# Altium project RF-Hub-v1.0.PrjPcb (part 2 of 4)

## Sheet CC1101.SchDoc
size 420 x 297 mm; SheetNumber: 3; SheetTotal: 5
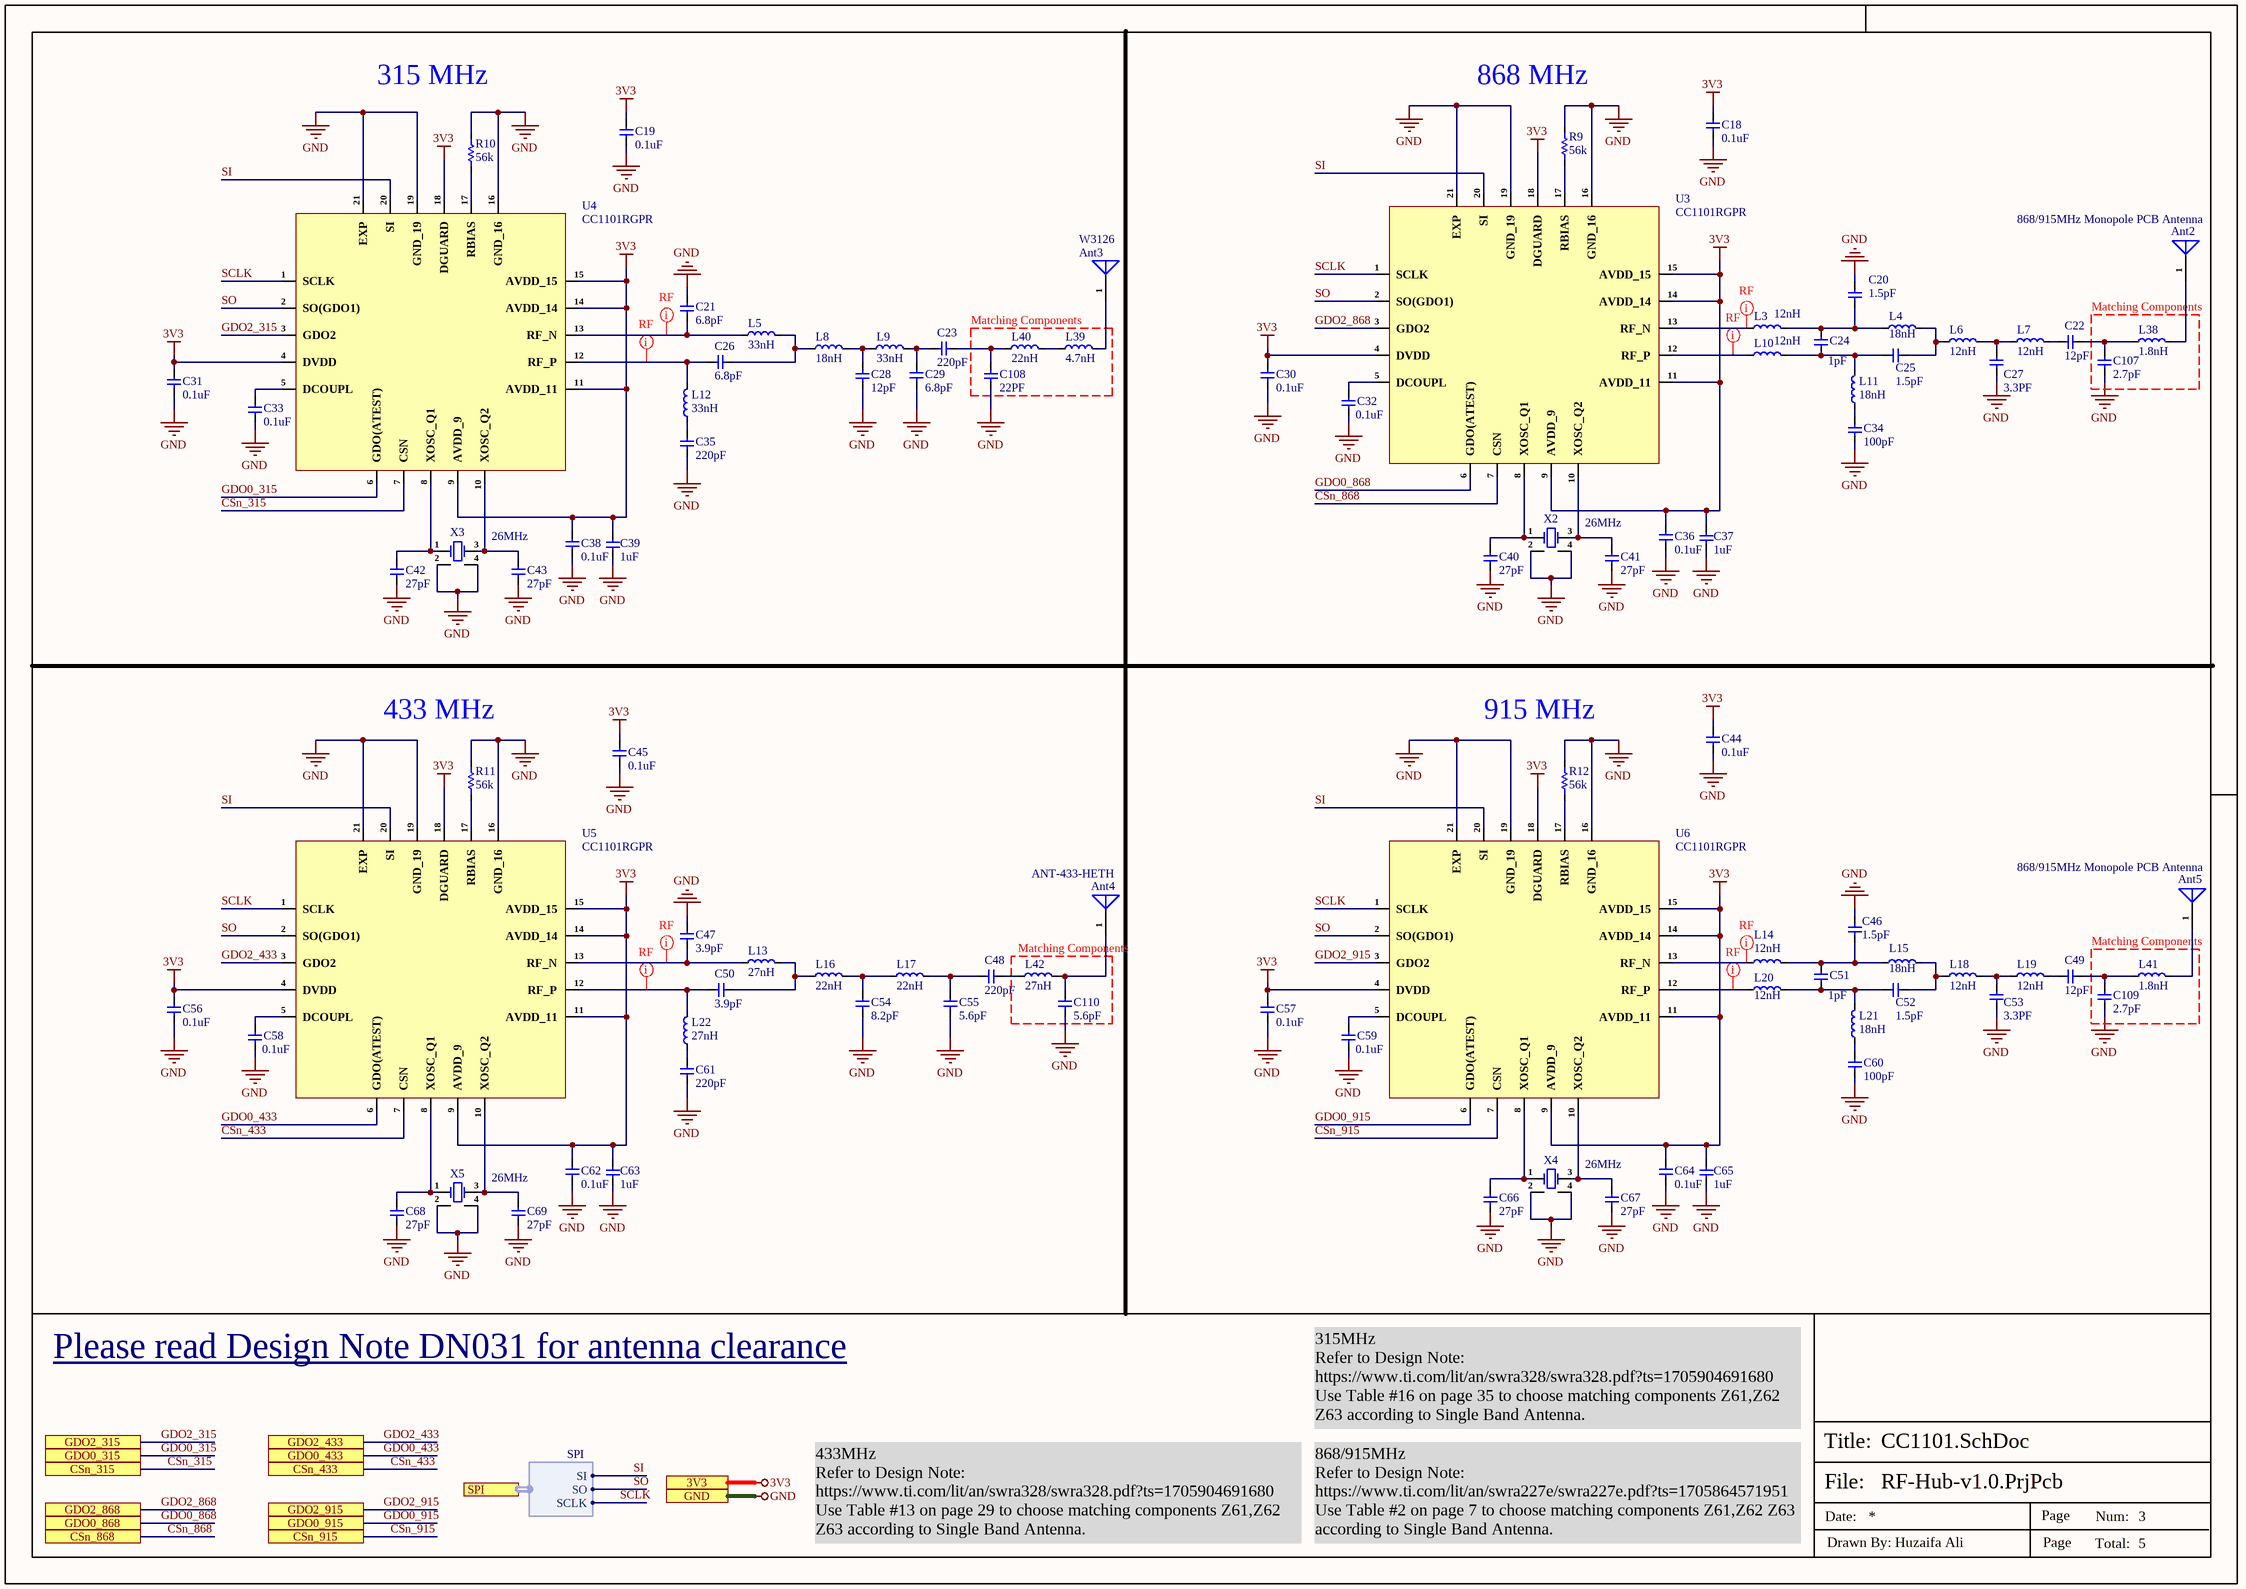
[diagram p1: CC1101.SchDoc]

### Parts
Ant2  868/915MHz Monopole PCB Antenna  [868/915MHz Monopole PCB Antenna]
Ant3  W3126  [W3126]
Ant4  ANT-433-HETH  [ANT-433-HETH]
Ant5  868/915MHz Monopole PCB Antenna  [868/915MHz Monopole PCB Antenna]
C18  0.1uF  [Cap-0402]
C19  0.1uF  [Cap-0402]
C20  1.5pF  [Cap-0402]
C21  6.8pF  [Cap-0402]
C22  12pF  [Cap-0402]
C23  220pF  [Cap-0402]
C24  1pF  [Cap-0402]
C25  1.5pF  [Cap-0402]
C26  6.8pF  [Cap-0402]
C27  3.3PF  [Cap-0402]
C28  12pF  [Cap-0402]
C29  6.8pF  [Cap-0402]
C30  0.1uF  [Cap-0402]
C31  0.1uF  [Cap-0402]
C32  0.1uF  [Cap-0402]
C33  0.1uF  [Cap-0402]
C34  100pF  [Cap-0402]
C35  220pF  [Cap-0402]
C36  0.1uF  [Cap-0402]
C37  1uF  [Cap-0402]
C38  0.1uF  [Cap-0402]
C39  1uF  [Cap-0402]
C40  27pF  [Cap-0402]
C41  27pF  [Cap-0402]
C42  27pF  [Cap-0402]
C43  27pF  [Cap-0402]
C44  0.1uF  [Cap-0402]
C45  0.1uF  [Cap-0402]
C46  1.5pF  [Cap-0402]
C47  3.9pF  [Cap-0402]
C48  220pF  [Cap-0402]
C49  12pF  [Cap-0402]
C50  3.9pF  [Cap-0402]
C51  1pF  [Cap-0402]
C52  1.5pF  [Cap-0402]
C53  3.3PF  [Cap-0402]
C54  8.2pF  [Cap-0402]
C55  5.6pF  [Cap-0402]
C56  0.1uF  [Cap-0402]
C57  0.1uF  [Cap-0402]
C58  0.1uF  [Cap-0402]
C59  0.1uF  [Cap-0402]
C60  100pF  [Cap-0402]
C61  220pF  [Cap-0402]
C62  0.1uF  [Cap-0402]
C63  1uF  [Cap-0402]
C64  0.1uF  [Cap-0402]
C65  1uF  [Cap-0402]
C66  27pF  [Cap-0402]
C67  27pF  [Cap-0402]
C68  27pF  [Cap-0402]
C69  27pF  [Cap-0402]
C107  2.7pF  [CAP-0201]
C108  22PF  [Cap-0402]
C109  2.7pF  [CAP-0201]
C110  5.6pF  [Cap-0402]
L3  12nH  [IND-0402]
L4  18nH  [IND-0402]
L5  33nH  [IND-0402]
L6  12nH  [IND-0402]
L7  12nH  [IND-0402]
L8  18nH  [IND-0402]
L9  33nH  [IND-0402]
L10  12nH  [IND-0402]
L11  18nH  [IND-0402]
L12  33nH  [IND-0402]
L13  27nH  [IND-0402]
L14  12nH  [IND-0402]
L15  18nH  [IND-0402]
L16  22nH  [IND-0402]
L17  22nH  [IND-0402]
L18  12nH  [IND-0402]
L19  12nH  [IND-0402]
L20  12nH  [IND-0402]
L21  18nH  [IND-0402]
L22  27nH  [IND-0402]
L38  1.8nH  [IND-0402]
L39  4.7nH  [IND-0402]
L40  22nH  [IND-0402]
L41  1.8nH  [IND-0402]
L42  27nH  [IND-0402]
R9  56k  [Res-0402]
R10  56k  [Res-0402]
R11  56k  [Res-0402]
R12  56k  [Res-0402]
U3  CC1101RGPR  [20-QFN (4x4)]
U4  CC1101RGPR  [20-QFN (4x4)]
U5  CC1101RGPR  [20-QFN (4x4)]
U6  CC1101RGPR  [20-QFN (4x4)]
X2  26MHz  [NX3225GA-26MHZ-EXS00A-CG01972]
X3  26MHz  [NX3225GA-26MHZ-EXS00A-CG01972]
X4  26MHz  [NX3225GA-26MHZ-EXS00A-CG01972]
X5  26MHz  [NX3225GA-26MHZ-EXS00A-CG01972]

### Blocks framed on the sheet
Matching Components: C107 L38
Matching Components: C108 L39 L40
Matching Components: C110 L42
Matching Components: C109 L41

### Ports
3V3 (see Top-Sheet[1C], Controller-Sheet[2D], Power-Sheet[1D], Wide-Band[2D]), CSn_315 (see Top-Sheet[2B], Controller-Sheet[1D]), CSn_433 (see Top-Sheet[2B], Controller-Sheet[1D]), CSn_868 (see Top-Sheet[2B], Controller-Sheet[1D]), CSn_915 (see Top-Sheet[2B], Controller-Sheet[1D]), GDO0_315 (see Top-Sheet[2B], Controller-Sheet[1D]), GDO0_433 (see Top-Sheet[2B], Controller-Sheet[1D]), GDO0_868 (see Top-Sheet[2B], Controller-Sheet[1D]), GDO0_915 (see Top-Sheet[2B], Controller-Sheet[1D]), GDO2_315 (see Top-Sheet[2B], Controller-Sheet[1D]), GDO2_433 (see Top-Sheet[2B], Controller-Sheet[1D]), GDO2_868 (see Top-Sheet[2B], Controller-Sheet[1D]), GDO2_915 (see Top-Sheet[2B], Controller-Sheet[1D]), GND (see Top-Sheet[1C], Controller-Sheet[2D], Power-Sheet[1D], Wide-Band[2D]), SPI (harness SPI, see Top-Sheet[1B], Controller-Sheet[3D], Wide-Band[1D])

### Harnesses
SPI: SI, SO, SCLK

### Nets
3V3: C18.1 C19.1 C30.1 C31.1 C36.1 C37.2 C38.1 C39.2 C44.1 C45.1 C56.1 C57.1 C62.1 C63.2 C64.1 C65.2 U3.4(DVDD) U3.9(AVDD_9) U3.11(AVDD_11) U3.14(AVDD_14) U3.15(AVDD_15) U3.18(DGUARD) U4.4(DVDD) U4.9(AVDD_9) U4.11(AVDD_11) U4.14(AVDD_14) U4.15(AVDD_15) U4.18(DGUARD) U5.4(DVDD) U5.9(AVDD_9) U5.11(AVDD_11) U5.14(AVDD_14) U5.15(AVDD_15) U5.18(DGUARD) U6.4(DVDD) U6.9(AVDD_9) U6.11(AVDD_11) U6.14(AVDD_14) U6.15(AVDD_15) U6.18(DGUARD) ; port 3V3
GND: C18.2 C19.2 C20.2 C21.2 C27.1 C28.1 C29.2 C30.2 C31.2 C32.1 C33.1 C34.1 C35.1 C36.2 C37.1 C38.2 C39.1 C40.1 C41.1 C42.1 C43.1 C44.2 C45.2 C46.2 C47.2 C53.1 C54.1 C55.1 C56.2 C57.2 C58.1 C59.1 C60.1 C61.1 C62.2 C63.1 C64.2 C65.1 C66.1 C67.1 C68.1 C69.1 C107.1 C108.1 C109.1 C110.1 R9.2 R10.2 R11.2 R12.2 U3.16(GND_16) U3.19(GND_19) U3.21(EXP) U4.16(GND_16) U4.19(GND_19) U4.21(EXP) U5.16(GND_16) U5.19(GND_19) U5.21(EXP) U6.16(GND_16) U6.19(GND_19) U6.21(EXP) X2.2(GND) X2.4(GND) X3.2(GND) X3.4(GND) X4.2(GND) X4.4(GND) X5.2(GND) X5.4(GND) ; port GND
CSn_315: U4.7(CSN) ; port CSn_315
CSn_433: U5.7(CSN) ; port CSn_433
CSn_868: U3.7(CSN) ; port CSn_868
CSn_915: U6.7(CSN) ; port CSn_915
GDO0_315: U4.6(GDO(ATEST)) ; port GDO0_315
GDO0_433: U5.6(GDO(ATEST)) ; port GDO0_433
GDO0_868: U3.6(GDO(ATEST)) ; port GDO0_868
GDO0_915: U6.6(GDO(ATEST)) ; port GDO0_915
GDO2_315: U4.3(GDO2) ; port GDO2_315
GDO2_433: U5.3(GDO2) ; port GDO2_433
GDO2_868: U3.3(GDO2) ; port GDO2_868
GDO2_915: U6.3(GDO2) ; port GDO2_915
SCLK: U3.1(SCLK) U4.1(SCLK) U5.1(SCLK) U6.1(SCLK) ; port SPI.SCLK
SI: U3.20(SI) U4.20(SI) U5.20(SI) U6.20(SI) ; port SPI.SI
SO: U3.2(SO(GDO1)) U4.2(SO(GDO1)) U5.2(SO(GDO1)) U6.2(SO(GDO1)) ; port SPI.SO
NetAnt2_1: Ant2.1(FEED) L38.2
NetAnt3_1: Ant3.1(FEED) L39.2
NetAnt4_1: Ant4.1(FEED) C110.2 L42.2
NetAnt5_1: Ant5.1(FEED) L41.2
NetC20_1: C20.1 C24.2 L3.2 L4.1
NetC21_1: C21.1 L5.1 U4.13(RF_N)
NetC22_1: C22.1 L7.2
NetC22_2: C22.2 C107.2 L38.1
NetC23_1: C23.1 C108.2 L40.1
NetC23_2: C23.2 C29.1 L9.2
NetC24_1: C24.1 C25.2 L10.2 L11.2
NetC25_1: C25.1 L4.2 L6.1
NetC26_1: C26.1 L12.2 U4.12(RF_P)
NetC26_2: C26.2 L5.2 L8.1
NetC27_2: C27.2 L6.2 L7.1
NetC28_2: C28.2 L8.2 L9.1
NetC32_2: C32.2 U3.5(DCOUPL)
NetC33_2: C33.2 U4.5(DCOUPL)
NetC34_2: C34.2 L11.1
NetC35_2: C35.2 L12.1
NetC40_2: C40.2 U3.8(XOSC_Q1) X2.1(OSC1)
NetC41_2: C41.2 U3.10(XOSC_Q2) X2.3(OSC2)
NetC42_2: C42.2 U4.8(XOSC_Q1) X3.1(OSC1)
NetC43_2: C43.2 U4.10(XOSC_Q2) X3.3(OSC2)
NetC46_1: C46.1 C51.2 L14.2 L15.1
NetC47_1: C47.1 L13.1 U5.13(RF_N)
NetC48_1: C48.1 L42.1
NetC48_2: C48.2 C55.2 L17.2
NetC49_1: C49.1 L19.2
NetC49_2: C49.2 C109.2 L41.1
NetC50_1: C50.1 L13.2 L16.1
NetC50_2: C50.2 L22.2 U5.12(RF_P)
NetC51_1: C51.1 C52.2 L20.2 L21.2
NetC52_1: C52.1 L15.2 L18.1
NetC53_2: C53.2 L18.2 L19.1
NetC54_2: C54.2 L16.2 L17.1
NetC58_2: C58.2 U5.5(DCOUPL)
NetC59_2: C59.2 U6.5(DCOUPL)
NetC60_2: C60.2 L21.1
NetC61_2: C61.2 L22.1
NetC66_2: C66.2 U6.8(XOSC_Q1) X4.1(OSC1)
NetC67_2: C67.2 U6.10(XOSC_Q2) X4.3(OSC2)
NetC68_2: C68.2 U5.8(XOSC_Q1) X5.1(OSC1)
NetC69_2: C69.2 U5.10(XOSC_Q2) X5.3(OSC2)
NetL3_1: L3.1 U3.13(RF_N)
NetL10_1: L10.1 U3.12(RF_P)
NetL14_1: L14.1 U6.13(RF_N)
NetL20_1: L20.1 U6.12(RF_P)
NetL39_1: L39.1 L40.2
NetR9_1: R9.1 U3.17(RBIAS)
NetR10_1: R10.1 U4.17(RBIAS)
NetR11_1: R11.1 U5.17(RBIAS)
NetR12_1: R12.1 U6.17(RBIAS)

### Layout directives
net class RF: NetC21_1, NetC26_1, NetC47_1, NetC50_2, NetL3_1, NetL10_1, NetL14_1, NetL20_1

### Notes on the sheet
- (near R10) 315 MHz
- (near R9) 868 MHz
- (near R11) 433 MHz
- (near R12) 915 MHz
- Please read Design Note DN031 for antenna clearance <https://www.ti.com/lit/an/swra328/swra328.pdf?ts=1705904691680>
- 315MHz
  Refer to Design Note: https://www.ti.com/lit/an/swra328/swra328.pdf?ts=1705904691680
  Use Table #16 on page 35 to choose matching components Z61,Z62 Z63 according to Single Band Antenna.
- 433MHz
  Refer to Design Note: https://www.ti.com/lit/an/swra328/swra328.pdf?ts=1705904691680
  Use Table #13 on page 29 to choose matching components Z61,Z62 Z63 according to Single Band Antenna.
- 868/915MHz
  Refer to Design Note: https://www.ti.com/lit/an/swra227e/swra227e.pdf?ts=1705864571951
  Use Table #2 on page 7 to choose matching components Z61,Z62 Z63 according to Single Band Antenna.
- File:
- Title:
- Date:
- Page
- Num:
- Total:
- Drawn By: Huzaifa Ali

### Library data of the parts
Ant2 Ant5 = 868/915MHz Monopole PCB Antenna: Monopole PCB Antenna with Single or Dual Band Option; Manufacturer Part Number: 868/915MHz Monopole PCB Antenna; Item Type: Antenna; ComponentLink1Description: Anttena; ComponentLink1URL: https://www.ti.com/lit/an/swra227e/swra227e.pdf?ts=1705864571951
Ant3 = W3126: RF ANT 315MHZ HELICAL SOLDER SMD; Manufacturer: Pulse; Impedance: 50R; Number of Bands: 1; Return Loss: -10dB; Gain: -5dB; VSWR: 1.9; Item Type: Antenna; Supplier: Mouser; Supplier Part Number: 673-W3126; Manufacturer Part Number: W3126; RoHS: Yes; Category: RF Antennas; Stock: 256; Pricing: 1=1.73, 10=1.55, 50=1.55, 100=1.25, 1000=0.852, 10000=0.735 (USD); Mounting Technology: Surface Mount,Through Hole,PCB; Packaging: Tray; Series: -; Package Quantity: 1600; Termination: Solder; Frequency: 315MHz; Height: 0.276inch; Radiation Hardening: No; ComponentLink1URL: https://datasheet.ciiva.com/8153/+w3126-8153071.pdf?src-supplier=Avnet; ComponentLink1Description: https://datasheet.ciiva.com/8153/+w3126-8153071.pdf?src-supplier=Avnet; ComponentLink2URL: https://datasheet.ciiva.com/2792/+w3126-2792620.pdf?src-supplier=Digikey; ComponentLink2Description: https://datasheet.ciiva.com/2792/+w3126-2792620.pdf?src-supplier=Digikey
Ant4 = ANT-433-HETH: RF ANT 433MHZ HELICAL SLD TH; Manufacturer: TE Connectivity; Item Type: Antenna; Manufacturer Part Number: ANT-433-HETH; Package: Custom
C18 C19 C30 C31 C36 C38 C44 C45 C56 C57 C62 C64 = C1005X5R1H104K050BB: CAP CER 0.1UF 50V X5R 0402; Manufacturer: TDK; Dielectric Material: Ceramic; Capacitance: 100nF; Tolerance: 10%; Supplier 1: Digi-Key; Manufacturer Part Number: C1005X5R1H104K050BB; Stock 1: 1455182; Pricing 1: 1=0.12, 10=0.09, 50=0.049, 100=0.04, 500=0.02858, 1000=0.02245, 2500=0.02041, 5000=0.01878 (USD); Mount: Surface Mount; Case/Package: 0402; Case Code (Metric): 1005; Case Code (Imperial): 0402; Weight: 2.3E-05oz; Min Operating Temperature: -55°C; Max Operating Temperature: 85°C; Dielectric: X5R; Voltage Rating: 50V; Packaging: Tape and Reel; Voltage Rating (DC): 50V; Termination: SMD/SMT; Construction: Flat; Package Quantity: 1; Resistor Type: Ceramic; Voltage: 50V; Series: C; Length: 1mm; Width: 0.02inch; Height: 0.5mm; Depth: 0.5mm; Thickness: 0.022inch; Radiation Hardening: No; Lead Free: Lead Free; REACH SVHC: No SVHC; RoHS Compliant: Yes; ComponentLink1URL: https://product.tdk.com/info/en/catalog/spec/mlccspec_commercial_general_midvoltage_en.pdf?src-supplier=Digi-Key; ComponentLink1Description: https://product.tdk.com/info/en/catalog/spec/mlccspec_commercial_general_midvoltage_en.pdf?src-supplier=Digi-Key; ComponentLink2URL: http://www.tdk.co.jp/tefe02/e413_c.pdf?src-supplier=Future+Electronics; ComponentLink2Description: http://www.tdk.co.jp/tefe02/e413_c.pdf?src-supplier=Future+Electronics; ComponentLink3URL: https://www.verical.com/server-webapp/html/getDatasheet?partID=743571&src-supplier=Verical; ComponentLink3Description: https://www.verical.com/server-webapp/html/getDatasheet?partID=743571&src-supplier=Verical; ComponentLink4URL: http://www.tdk.co.jp/tefe02/e412_c.pdf?src-supplier=Avnet+Europe; ComponentLink4Description: http://www.tdk.co.jp/tefe02/e412_c.pdf?src-supplier=Avnet+Europe; Supplier Part Number 1: 445-5942-1-ND; LCSC Part Number: C2181865
C20 C25 C46 C52 = CC0402BRNPO9BN1R5: CAP CER 1.5PF 50V C0G/NPO 0402; Manufacturer: Yageo; Temperature Coefficient: 30ppm/°C; Item Type: Capacitor; Supplier: Future Electronics; Supplier Part Number: 6564710; Manufacturer Part Number: CC0402BRNPO9BN1R5; RoHS: Yes; Category: Ceramic Capacitors; Stock: 530000; Pricing: 10000=0.0033, 40000=0.0031, 150000=0.003, 300000=0.0029, 750000=0.0027 (USD); Halogen Free: 5694HalogenFree; ComponentLink1URL: https://datasheet.ciiva.com/15189/getdatasheetpartid-403423-15189101.pdf?src-supplier=Verical; ComponentLink1Description: https://datasheet.ciiva.com/15189/getdatasheetpartid-403423-15189101.pdf?src-supplier=Verical; ComponentLink2URL: https://datasheet.ciiva.com/11587/upy-gp-np0-16v-to-50v-8-11587119.pdf?src-supplier=Avnet; ComponentLink2Description: https://datasheet.ciiva.com/11587/upy-gp-np0-16v-to-50v-8-11587119.pdf?src-supplier=Avnet; ComponentLink3URL: https://datasheet.ciiva.com/13263/upy-gp-np0-16v-to-50v-8-3714-13263317.pdf?src-supplier=Mouser; ComponentLink3Description: https://datasheet.ciiva.com/13263/upy-gp-np0-16v-to-50v-8-3714-13263317.pdf?src-supplier=Mouser; LCSC Part Number: C282238
C21 C26 C29 = CC0402CRNPO9BN6R8: CAP CER 6.8PF 50V C0G/NPO 0402; Manufacturer: Yageo; Dielectric: C0G; Tolerance: 2%; Insulation Resistance: 10GR; Item Type: Capacitor; Supplier: Future Electronics; Supplier Part Number: 3247368; Manufacturer Part Number: CC0402CRNPO9BN6R8; RoHS: Yes; Category: Ceramic Capacitors; Stock: 200000; Pricing: 10000=0.0024, 40000=0.0022, 150000=0.0021, 400000=0.002, 1000000=0.0019 (USD); Mounting Technology: Surface Mount; Case/Package: 0402; Case Code (Imperial): 0402; Case Code (Metric): 1005; Weight: 2.3E-05oz; Min Operating Temperature: -55°C; Max Operating Temperature: 125°C; Value: 6.8pF; Packaging: Tape and Reel; Voltage Rating: 50V; Voltage Rating (DC): 50V; Termination: SMD/SMT; Series: CC; Construction: Flat; Length: 1mm; Width: 0.5mm; Height: 0.5mm; Depth: 0.5mm; Radiation Hardening: No; RoHS Compliant: Yes; ComponentLink1URL: https://datasheet.ciiva.com/11587/upy-gp-np0-16v-to-50v-8-11587182.pdf?src-supplier=Avnet; ComponentLink1Description: https://datasheet.ciiva.com/11587/upy-gp-np0-16v-to-50v-8-11587182.pdf?src-supplier=Avnet; LCSC Part Number: C189470
C22 C28 C49 = GJM1555C1H120GB01D: CAP CER 12PF 50V C0G/NP0 0402; Manufacturer: Murata; Tolerance: 2%; Dielectric: C0G; Supplier 1: Digi-Key; Manufacturer Part Number: GJM1555C1H120GB01D; RoHS: Yes; Category: Ceramic Capacitors; Stock 1: 266975; Pricing 1: 1=0.18000, 10=0.12600, 50=0.07560, 100=0.06390, 500=0.04370, 1000=0.03865, 2500=0.03698, 5000=0.03361 (USD); Mount: Surface Mount; Case/Package: 0402; Case Code (Imperial): 0402; Case Code (Metric): 1005; Min Operating Temperature: -55°C; Max Operating Temperature: 125°C; Capacitance: 12pF; Voltage Rating: 50V; Voltage Rating (DC): 50V; Packaging: Tape and Reel; Package Quantity: 10000; Termination: SMD/SMT; Series: GJM; Construction: Flat; Length: 1mm; Width: 0.5mm; Height: 0.5mm; Thickness: 0.022inch; Depth: 0.5mm; Radiation Hardening: No; Lead Free: Lead Free; RoHS Compliant: Yes; ComponentLink1URL: https://datasheet.ciiva.com/11608/product-11608208.pdf?src-supplier=Avnet; ComponentLink1Description: https://datasheet.ciiva.com/11608/product-11608208.pdf?src-supplier=Avnet; ComponentLink2URL: https://datasheet.ciiva.com/29542/partnumbering-e-01-29542716.pdf?src-supplier=Digi-Key; ComponentLink2Description: https://datasheet.ciiva.com/29542/partnumbering-e-01-29542716.pdf?src-supplier=Digi-Key; ComponentLink3URL: https://datasheet.ciiva.com/29542/partnumbering-e-01-29542715.pdf?src-supplier=Digi-Key; ComponentLink3Description: https://datasheet.ciiva.com/29542/partnumbering-e-01-29542715.pdf?src-supplier=Digi-Key; ComponentLink4URL: https://datasheet.ciiva.com/29542/partnumbering-e-01-29542717.pdf?src-supplier=Digi-Key; ComponentLink4Description: https://datasheet.ciiva.com/29542/partnumbering-e-01-29542717.pdf?src-supplier=Digi-Key; Supplier Part Number 1: 490-8078-1-ND; LCSC Part Number: C161305
C23 C35 C48 C61 = CC0402JRNPO9BN221: CAP CER 220PF 50V C0G/NPO 0402; Manufacturer: Yageo; Dielectric Material: Ceramic; Tolerance: 10%; Dielectric: C0G; Temperature Coefficient: 30ppm/°C; Insulation Resistance: 10GR; Dissipation Factor: 0.1%; Supplier 1: RSComponents; Manufacturer Part Number: CC0402JRNPO9BN221; RoHS: Yes; Category: Ceramic Capacitors; Stock 1: 20000; Pricing 1: 10000=0.00600, 100000=0.00600 (GBP); Mount: Surface Mount; Case/Package: 0402; Number of Pins: 2; Case Code (Metric): 1005; Case Code (Imperial): 0402; Min Operating Temperature: -55°C; Max Operating Temperature: 125°C; Capacitance: 220pF; Package Quantity: 1; Voltage Rating: 50V; Packaging: Tape and Reel; Termination: SMD/SMT; Voltage: 50V; Series: CC; Length: 1mm; Width: 0.02inch; Height: 0.5mm; Thickness: 0.022inch; Depth: 0.5mm; Radiation Hardening: No; RoHS Compliant: Yes; REACH SVHC: No SVHC; Lead Free: Lead Free; ComponentLink1URL: https://datasheet.ciiva.com/11786/0900766b8079c870-11786154.pdf?src-supplier=RSComponents; ComponentLink1Description: https://datasheet.ciiva.com/11786/0900766b8079c870-11786154.pdf?src-supplier=RSComponents; ComponentLink2URL: https://datasheet.ciiva.com/7656/1132289-7656616.pdf?src-supplier=Element14; ComponentLink2Description: https://datasheet.ciiva.com/7656/1132289-7656616.pdf?src-supplier=Element14; ComponentLink3URL: https://datasheet.ciiva.com/8033/1443161-8033609.pdf?src-supplier=Element14; ComponentLink3Description: https://datasheet.ciiva.com/8033/1443161-8033609.pdf?src-supplier=Element14; ComponentLink4URL: https://datasheet.ciiva.com/8033/1443161-8033608.pdf?src-supplier=Element14; ComponentLink4Description: https://datasheet.ciiva.com/8033/1443161-8033608.pdf?src-supplier=Element14; ComponentLink5URL: https://datasheet.ciiva.com/176/mlccorderingcode-176384.pdf?src-supplier=Digi-Key; ComponentLink5Description: https://datasheet.ciiva.com/176/mlccorderingcode-176384.pdf?src-supplier=Digi-Key; ComponentLink6URL: https://datasheet.ciiva.com/176/mlccorderingcode-176383.pdf?src-supplier=Digi-Key; ComponentLink6Description: https://datasheet.ciiva.com/176/mlccorderingcode-176383.pdf?src-supplier=Digi-Key; ComponentLink7URL: https://datasheet.ciiva.com/176/mlccorderingcode-176385.pdf?src-supplier=Digi-Key; ComponentLink7Description: https://datasheet.ciiva.com/176/mlccorderingcode-176385.pdf?src-supplier=Digi-Key; ComponentLink8URL: https://datasheet.ciiva.com/17434/upy-gp-np0-16v-to-50v-8-17434343.pdf?src-supplier=Avnet+Europe; ComponentLink8Description: https://datasheet.ciiva.com/17434/upy-gp-np0-16v-to-50v-8-17434343.pdf?src-supplier=Avnet+Europe; Supplier Part Number 1: 6169284; LCSC Part Number: C107001
C24 C51 = CC0402BRNPO9BN1R0: CAP CER 1PF 50V C0G/NPO 0402; Manufacturer: Yageo; Temperature Coefficient: 30ppm/°C; Item Type: Capacitor; Supplier: Future Electronics; Supplier Part Number: 7847221; Manufacturer Part Number: CC0402BRNPO9BN1R0; RoHS: Yes; Category: Ceramic Capacitors; Stock: 180000; Pricing: 10000=0.0034, 40000=0.0032, 150000=0.0031, 250000=0.003, 500000=0.0028 (USD); Halogen Free: 5694HalogenFree; ComponentLink1URL: https://datasheet.ciiva.com/26862/getdatasheetpartid-403422-26862565.pdf?src-supplier=Verical; ComponentLink1Description: https://datasheet.ciiva.com/26862/getdatasheetpartid-403422-26862565.pdf?src-supplier=Verical; ComponentLink2URL: https://datasheet.ciiva.com/11587/upy-gp-np0-16v-to-50v-8-11587115.pdf?src-supplier=Avnet; ComponentLink2Description: https://datasheet.ciiva.com/11587/upy-gp-np0-16v-to-50v-8-11587115.pdf?src-supplier=Avnet; LCSC Part Number: C309455
C27 C53 = RF15N3R3C500CT: CAP CER 3.3PF 50V C0G/NP0 0402; Manufacturer: Walsin Tech Corp; Item Type: Capacitor; Manufacturer Part Number: RF15N3R3C500CT; Package: 0402; LCSC Part Number: C172822; ComponentLink1Description: LCSC; ComponentLink1URL: https://www.lcsc.com/product-detail/Multilayer-Ceramic-Capacitors-MLCC-SMD-SMT_Walsin-Tech-Corp-RF15N3R3C500CT_C172822.html
C32 C33 C58 C59 = C1005X5R1H104K050BB: CAP CER 0.1UF 50V X5R 0402; Manufacturer: TDK; Dielectric Material: Ceramic; Capacitance: 100nF; Tolerance: 10%; Item Type: Capacitor; Supplier 1: Digi-Key; Manufacturer Part Number: C1005X5R1H104K050BB; Stock 1: 1455182; Pricing 1: 1=0.12, 10=0.09, 50=0.049, 100=0.04, 500=0.02858, 1000=0.02245, 2500=0.02041, 5000=0.01878 (USD); Mount: Surface Mount; Case/Package: 0402; Case Code (Metric): 1005; Case Code (Imperial): 0402; Weight: 2.3E-05oz; Min Operating Temperature: -55°C; Max Operating Temperature: 85°C; Dielectric: X5R; Voltage Rating: 50V; Packaging: Tape and Reel; Voltage Rating (DC): 50V; Termination: SMD/SMT; Construction: Flat; Package Quantity: 1; Resistor Type: Ceramic; Voltage: 50V; Series: C; Length: 1mm; Width: 0.02inch; Height: 0.5mm; Depth: 0.5mm; Thickness: 0.022inch; Radiation Hardening: No; Lead Free: Lead Free; REACH SVHC: No SVHC; RoHS Compliant: Yes; ComponentLink1URL: https://product.tdk.com/info/en/catalog/spec/mlccspec_commercial_general_midvoltage_en.pdf?src-supplier=Digi-Key; ComponentLink1Description: https://product.tdk.com/info/en/catalog/spec/mlccspec_commercial_general_midvoltage_en.pdf?src-supplier=Digi-Key; ComponentLink2URL: http://www.tdk.co.jp/tefe02/e413_c.pdf?src-supplier=Future+Electronics; ComponentLink2Description: http://www.tdk.co.jp/tefe02/e413_c.pdf?src-supplier=Future+Electronics; ComponentLink3URL: https://www.verical.com/server-webapp/html/getDatasheet?partID=743571&src-supplier=Verical; ComponentLink3Description: https://www.verical.com/server-webapp/html/getDatasheet?partID=743571&src-supplier=Verical; ComponentLink4URL: http://www.tdk.co.jp/tefe02/e412_c.pdf?src-supplier=Avnet+Europe; ComponentLink4Description: http://www.tdk.co.jp/tefe02/e412_c.pdf?src-supplier=Avnet+Europe; Supplier Part Number 1: 445-5942-1-ND; LCSC Part Number: C2181865
C34 C60 = 04025A101JAT2A: CAP CER 100PF 50V C0G/NP0 0402; Manufacturer: Kyocera AVX; Tolerance: 5%; Dielectric: C0G; Insulation Resistance: 1GR; Temperature Coefficient: 30ppm/°C; Dissipation Factor: 2.5%; Item Type: Capacitor; Supplier 1: Avnet; Manufacturer Part Number: 04025A101JAT2A; RoHS: Yes; Category: Ceramic Capacitors; Stock 1: 3437500; Pricing 1: 10000=0.10788, 20000=0.10540, 40000=0.10292, 60000=0.10044, 80000=0.09796, 100000=0.09548, 1000000=0.09424 (USD); Mount: Surface Mount,PCB; Case/Package: 0402; Case Code (Metric): 1005; Case Code (Imperial): 0402; Contact Plating: Tin,Matte; Min Operating Temperature: -55°C; Max Operating Temperature: 125°C; Capacitance: 100pF; Voltage Rating (DC): 50V; Packaging: Tape and Reel; Voltage Rating: 50V; Package Quantity: 10000; Termination: SMD/SMT; Voltage: 50V; Series: -; Construction: Flat; Length: 1mm; Width: 0.004inch; Height: 0.56mm; Thickness: 0.013inch; Depth: 0.5mm; Radiation Hardening: No; Reach SVHC Compliant: Yes; Lead Free: Lead Free; RoHS Compliant: Yes; ComponentLink1URL: https://datasheet.ciiva.com/11786/0900766b80def0e2-11786618.pdf?src-supplier=RSComponents; ComponentLink1Description: https://datasheet.ciiva.com/11786/0900766b80def0e2-11786618.pdf?src-supplier=RSComponents; ComponentLink2URL: https://datasheet.ciiva.com/1123/493359-1123473.pdf?src-supplier=Element14; ComponentLink2Description: https://datasheet.ciiva.com/1123/493359-1123473.pdf?src-supplier=Element14; ComponentLink3URL: https://datasheet.ciiva.com/1123/493359-1123474.pdf?src-supplier=Element14; ComponentLink3Description: https://datasheet.ciiva.com/1123/493359-1123474.pdf?src-supplier=Element14; ComponentLink4URL: https://datasheet.ciiva.com/16332/ccog-16332501.pdf?src-supplier=Future+Electronics; ComponentLink4Description: https://datasheet.ciiva.com/16332/ccog-16332501.pdf?src-supplier=Future+Electronics; ComponentLink5URL: https://datasheet.ciiva.com/46392/759117-46392007.pdf?src-supplier=Element14; ComponentLink5Description: https://datasheet.ciiva.com/46392/759117-46392007.pdf?src-supplier=Element14; ComponentLink6URL: https://datasheet.ciiva.com/150/ccog-150473.pdf?src-supplier=Digi-Key; ComponentLink6Description: https://datasheet.ciiva.com/150/ccog-150473.pdf?src-supplier=Digi-Key; ComponentLink7URL: https://datasheet.ciiva.com/150/ccog-150474.pdf?src-supplier=Digi-Key; ComponentLink7Description: https://datasheet.ciiva.com/150/ccog-150474.pdf?src-supplier=Digi-Key; ComponentLink8URL: https://datasheet.ciiva.com/2987/ccog-2987642.pdf?src-supplier=Avnet; ComponentLink8Description: https://datasheet.ciiva.com/2987/ccog-2987642.pdf?src-supplier=Avnet; ComponentLink9URL: https://datasheet.ciiva.com/150/ccog-150475.pdf?src-supplier=Digi-Key; ComponentLink9Description: https://datasheet.ciiva.com/150/ccog-150475.pdf?src-supplier=Digi-Key; ComponentLink10URL: https://datasheet.ciiva.com/8083/ccog-8083054.pdf?src-supplier=Avnet; ComponentLink10Description: https://datasheet.ciiva.com/8083/ccog-8083054.pdf?src-supplier=Avnet; ComponentLink11URL: https://datasheet.ciiva.com/5413/ccog-5413647.pdf?src-supplier=Mouser; ComponentLink11Description: https://datasheet.ciiva.com/5413/ccog-5413647.pdf?src-supplier=Mouser; Supplier Part Number 1: 04025A101JAT2A; LCSC Part Number: C597014
C37 C39 C63 C65 = CC0402KRX5R6BB105: CAP CER 1UF 10V X5R 0402; Manufacturer: Yageo; Tolerance: 10%; Dissipation Factor: 15%; Supplier 1: Mouser; Manufacturer Part Number: CC0402KRX5R6BB105; RoHS: Yes; Category: Ceramic Capacitors; Stock 1: 6711367; Pricing 1: 1=0.11000, 10=0.05500, 50=0.05500, 100=0.03300, 500=0.02700, 1000=0.02200, 2500=0.02100, 10000=0.01800 (USD); Mount: Surface Mount; Case/Package: 0402; Number of Pins: 2; Case Code (Metric): 1005; Case Code (Imperial): 0402; Min Operating Temperature: -55°C; Max Operating Temperature: 85°C; Capacitance: 1uF; Dielectric: X5R; Package Quantity: 1; Voltage Rating: 10V; Packaging: Tape and Reel; Voltage Rating (DC): 10V; Termination: SMD/SMT; Resistor Type: Ceramic; Series: CC; Construction: Flat; Length: 1mm; Width: 0.02inch; Height: 0.5mm; Thickness: 0.022inch; Depth: 0.5mm; Radiation Hardening: No; REACH SVHC: No SVHC; Lead Free: Lead Free; Halogen Free: Halogen Free; RoHS Compliant: Yes; ComponentLink1URL: https://datasheet.ciiva.com/176/upy-gphc-x5r-4v-to-50v-12-176704.pdf?src-supplier=Digi-Key; ComponentLink1Description: https://datasheet.ciiva.com/176/upy-gphc-x5r-4v-to-50v-12-176704.pdf?src-supplier=Digi-Key; ComponentLink2URL: https://datasheet.ciiva.com/176/mlccorderingcode-176705.pdf?src-supplier=Digi-Key; ComponentLink2Description: https://datasheet.ciiva.com/176/mlccorderingcode-176705.pdf?src-supplier=Digi-Key; ComponentLink3URL: https://datasheet.ciiva.com/176/mlccorderingcode-176706.pdf?src-supplier=Digi-Key; ComponentLink3Description: https://datasheet.ciiva.com/176/mlccorderingcode-176706.pdf?src-supplier=Digi-Key; Supplier Part Number 1: 603-CC402KRX5R6BB105; LCSC Part Number: C106254
C40-C43 C66-C69 = 0402N270J250CT: CAP CER 27PF 25V C0G/NP0 0402; Manufacturer: Walsin Technologies; Item Type: Capacitor; Supplier 1: Digi-Key; Manufacturer Part Number: 0402N270J250CT; Stock 1: 71180; Pricing 1: 1=0.1, 10=0.017, 50=0.0094, 100=0.0076, 500=0.00544, 1000=0.00427, 2500=0.00388, 5000=0.00357 (USD); RoHS Compliant: Yes; Supplier Part Number 1: 1292-1291-1-ND; LCSC Part Number: C424826; ComponentLink1Description: LCSC; ComponentLink1URL: https://lcsc.com/product-detail/Multilayer-Ceramic-Capacitors-MLCC-SMD-SMT_Walsin-Tech-Corp-0402N270J250CT_C424826.html
C47 C50 = CC0402BRNPO9BN3R9: CAP CER 3.9PF 50V C0G/NPO 0402; Manufacturer: Yageo; Item Type: Capacitor; Supplier: Future Electronics; Supplier Part Number: 4917324; Manufacturer Part Number: CC0402BRNPO9BN3R9; RoHS: Yes; Category: Ceramic Capacitors; Stock: 280000; Pricing: 10000=0.0034, 40000=0.0032, 150000=0.0031, 250000=0.003, 500000=0.0028 (USD); ComponentLink1URL: https://datasheet.ciiva.com/11587/upy-gp-np0-16v-to-50v-8-11587133.pdf?src-supplier=Avnet; ComponentLink1Description: https://datasheet.ciiva.com/11587/upy-gp-np0-16v-to-50v-8-11587133.pdf?src-supplier=Avnet; ComponentLink2URL: https://datasheet.ciiva.com/13211/upy-gp-np0-16v-to-50v-8-13211126.pdf?src-supplier=Mouser; ComponentLink2Description: https://datasheet.ciiva.com/13211/upy-gp-np0-16v-to-50v-8-13211126.pdf?src-supplier=Mouser; LCSC Part Number: C505474
C54 = CC0402DRNPO9BN8R2: CAP CER 8.2PF 50V C0G/NPO 0402; Manufacturer: Yageo; Item Type: Capacitor; Supplier: Future Electronics; Supplier Part Number: 2138063; Manufacturer Part Number: CC0402DRNPO9BN8R2; RoHS: Yes; Category: Ceramic Capacitors; Stock: 120000; Pricing: 10000=0.0024, 40000=0.0022, 150000=0.0021, 400000=0.002, 1000000=0.0019 (USD); ComponentLink1URL: https://datasheet.ciiva.com/144/mlccorderingcode-144589.pdf?src-supplier=Digikey; ComponentLink1Description: https://datasheet.ciiva.com/144/mlccorderingcode-144589.pdf?src-supplier=Digikey; ComponentLink2URL: https://datasheet.ciiva.com/144/mlccorderingcode-144590.pdf?src-supplier=Digikey; ComponentLink2Description: https://datasheet.ciiva.com/144/mlccorderingcode-144590.pdf?src-supplier=Digikey; ComponentLink3URL: https://datasheet.ciiva.com/144/mlccorderingcode-144591.pdf?src-supplier=Digikey; ComponentLink3Description: https://datasheet.ciiva.com/144/mlccorderingcode-144591.pdf?src-supplier=Digikey; ComponentLink4URL: https://datasheet.ciiva.com/13208/upy-gp-np0-16v-to-50v-8-13208987.pdf?src-supplier=Mouser; ComponentLink4Description: https://datasheet.ciiva.com/13208/upy-gp-np0-16v-to-50v-8-13208987.pdf?src-supplier=Mouser; ComponentLink5URL: https://datasheet.ciiva.com/11587/upy-gp-np0-16v-to-50v-8-11587051.pdf?src-supplier=Avnet; ComponentLink5Description: https://datasheet.ciiva.com/11587/upy-gp-np0-16v-to-50v-8-11587051.pdf?src-supplier=Avnet; LCSC Part Number: C327412
C55 C110 = CC0402BRNPO9BN5R6: CAP CER 5.6PF 50V C0G/NPO 0402; Manufacturer: Yageo; Item Type: Capacitor; Supplier: Future Electronics; Supplier Part Number: 3807997; Manufacturer Part Number: CC0402BRNPO9BN5R6; RoHS: Yes; Category: Ceramic Capacitors; Stock: 1840000; Pricing: 10000=0.0035, 40000=0.0031, 50000=0.0033, 150000=0.003, 250000=0.0031, 300000=0.0029, 500000=0.003, 750000=0.0027, 1500000=0.0028 (USD); Halogen Free: 5694HalogenFree; ComponentLink1URL: https://datasheet.ciiva.com/26829/getdatasheetpartid-403430-26829253.pdf?src-supplier=Verical; ComponentLink1Description: https://datasheet.ciiva.com/26829/getdatasheetpartid-403430-26829253.pdf?src-supplier=Verical; ComponentLink2URL: https://datasheet.ciiva.com/13265/upy-gp-np0-16v-to-50v-8-3714-13265516.pdf?src-supplier=Mouser; ComponentLink2Description: https://datasheet.ciiva.com/13265/upy-gp-np0-16v-to-50v-8-3714-13265516.pdf?src-supplier=Mouser; LCSC Part Number: C505468
C107 C109 = CC0201CRNPO9BN2R7: CAP CER 2.7PF 50V C0G/NPO 0201; Manufacturer: Yageo; Dielectric: C0G; Item Type: Capacitor; Supplier: Avnet; Supplier Part Number: CC0201CRNPO9BN2R7; Manufacturer Part Number: CC0201CRNPO9BN2R7; RoHS: Yes; Category: Ceramic Capacitors; Stock: 15000; Pricing: 15000=0.0017 (USD); Mounting Technology: Surface Mount; Case/Package: 0201; Case Code (Imperial): 0201; Case Code (Metric): 0603; Weight: 6E-06oz; Min Operating Temperature: -55°C; Max Operating Temperature: 125°C; Value: 2.7pF; Packaging: Tape and Reel; Voltage Rating (DC): 50V; Voltage Rating: 50V; Termination: SMD/SMT; Series: CC; Length: 0.024inch; Width: 0.012inch; Thickness: 0.013inch; RoHS Compliant: Yes; ComponentLink1URL: https://datasheet.ciiva.com/13208/upy-gp-np0-16v-to-50v-8-13208314.pdf?src-supplier=Mouser; ComponentLink1Description: https://datasheet.ciiva.com/13208/upy-gp-np0-16v-to-50v-8-13208314.pdf?src-supplier=Mouser; LCSC Part Number: C325439
C108 = CC0402JRNPO9BN220: CAP CER 22PF 50V C0G/NPO 0402; Manufacturer: Yageo; Dielectric Material: Ceramic; Tolerance: 5%; Dielectric: C0G; Temperature Coefficient: 30ppm/°C; Insulation Resistance: 100GR; Item Type: Capacitor; Supplier 1: Future Electronics; Manufacturer Part Number: CC0402JRNPO9BN220; RoHS: Yes; Category: Ceramic Capacitors; Stock 1: 200000; Pricing 1: 10000=0.00220, 40000=0.00210, 150000=0.00200, 400000=0.00190, 1000000=0.00180 (USD); Mounting Technology: Surface Mount; Case/Package: 0402; Pins: 2; Case Code (Metric): 1005; Case Code (Imperial): 0402; Min Operating Temperature: -55°C; Max Operating Temperature: 125°C; Value: 22pF; Voltage Rating: 50V; Packaging: Tape and Reel; Package Quantity: 1; Voltage Rating (DC): 50V; Termination: SMD/SMT; Resistor Type: Ceramic; Voltage: 50V; Series: CC; Length: 1mm; Width: 0.02inch; Height: 0.5mm; Thickness: 0.022inch; Depth: 0.5mm; Radiation Hardening: No; Reach SVHC Compliant: Yes; Lead Free: Lead Free; RoHS Compliant: Yes; ComponentLink1URL: https://datasheet.ciiva.com/5789/1443161-5789509.pdf?src-supplier=Farnell; ComponentLink1Description: https://datasheet.ciiva.com/5789/1443161-5789509.pdf?src-supplier=Farnell; ComponentLink2URL: https://datasheet.ciiva.com/8033/1443161-8033606.pdf?src-supplier=Element14; ComponentLink2Description: https://datasheet.ciiva.com/8033/1443161-8033606.pdf?src-supplier=Element14; ComponentLink3URL: https://datasheet.ciiva.com/7656/1132289-7656615.pdf?src-supplier=Element14; ComponentLink3Description: https://datasheet.ciiva.com/7656/1132289-7656615.pdf?src-supplier=Element14; ComponentLink4URL: https://datasheet.ciiva.com/8033/1443161-8033607.pdf?src-supplier=Element14; ComponentLink4Description: https://datasheet.ciiva.com/8033/1443161-8033607.pdf?src-supplier=Element14; ComponentLink5URL: https://datasheet.ciiva.com/8033/1443161-8033605.pdf?src-supplier=Element14; ComponentLink5Description: https://datasheet.ciiva.com/8033/1443161-8033605.pdf?src-supplier=Element14; ComponentLink6URL: https://datasheet.ciiva.com/143/mlccorderingcode-143987.pdf?src-supplier=Digi-Key; ComponentLink6Description: https://datasheet.ciiva.com/143/mlccorderingcode-143987.pdf?src-supplier=Digi-Key; ComponentLink7URL: https://datasheet.ciiva.com/143/mlccorderingcode-143986.pdf?src-supplier=Digi-Key; ComponentLink7Description: https://datasheet.ciiva.com/143/mlccorderingcode-143986.pdf?src-supplier=Digi-Key; ComponentLink8URL: https://datasheet.ciiva.com/143/mlccorderingcode-143988.pdf?src-supplier=Digi-Key; ComponentLink8Description: https://datasheet.ciiva.com/143/mlccorderingcode-143988.pdf?src-supplier=Digi-Key; ComponentLink9URL: https://datasheet.ciiva.com/5425/upy-gp-np0-16v-to-50v-8-5425483.pdf?src-supplier=Mouser; ComponentLink9Description: https://datasheet.ciiva.com/5425/upy-gp-np0-16v-to-50v-8-5425483.pdf?src-supplier=Mouser; ComponentLink10URL: https://datasheet.ciiva.com/15189/getdatasheetpartid-370074-15189117.pdf?src-supplier=Verical; ComponentLink10Description: https://datasheet.ciiva.com/15189/getdatasheetpartid-370074-15189117.pdf?src-supplier=Verical; Supplier Part Number 1: 9105957; LCSC Part Number: C106203
L3 L6 L7 L10 L14 L18-L20 = MHQ1005P12NGT000: FIXED IND 12NH 450MA 240MOHM SMD; Manufacturer: TDK; Item Type: Inductor; Supplier: Digikey; Supplier Part Number: 445-175572-1-ND; Manufacturer Part Number: MHQ1005P12NGT000; RoHS: Yes; Category: Fixed Inductors; Stock: 5317; Pricing: 1=0.18, 10=0.149, 25=0.1368, 50=0.1208, 100=0.1057, 250=0.10068, 500=0.09464, 1000=0.07249, 2500=0.06846 (USD); ComponentLink1URL: https://datasheet.ciiva.com/29693/inductor-commercial-high-frequency-mhq-en-29693630.pdf?src-supplier=Digikey; ComponentLink1Description: https://datasheet.ciiva.com/29693/inductor-commercial-high-frequency-mhq-en-29693630.pdf?src-supplier=Digikey; LCSC Part Number: C3911363
L4 L8 L11 L15 L21 = LQG15HS18NJ02D: FIXED IND 18NH 400MA 360MOHM SMD; Manufacturer: Murata; Core Material: Air; Tolerance: 5%; Self Resonant Frequency: 2.2GHz; Q Factor: 8; Current Rating: 300mA; Shielding: Unshielded; DC Resistance (DCR): 360mR; Test Frequency: 100MHz; Item Type: Inductor; Supplier: Rs; Supplier Part Number: 7254910P; Manufacturer Part Number: LQG15HS18NJ02D; RoHS: Yes; Category: Fixed Inductors; Stock: 4990; Pricing: 100=0.065, 250=0.058, 500=0.049, 1000=0.042 (GBP); Mounting Technology: Surface Mount; Case/Package: 0402; Case Code (Metric): 1005; Case Code (Imperial): 0402; Weight: 2.3E-05oz; Min Operating Temperature: -55°C; Max Operating Temperature: 125°C; Packaging: Tape and Reel; Package Quantity: 1; Inductance Tolerance: 5%; Value: 18nH; Max DC Current: 300mA; Termination: SMD/SMT; DC Current: 300mA; Series: LQG15HS; Max Current Rating: 300mA; Length: 0.039inch; Width: 0.02inch; Height: 0.5mm; Height - Seated (Max): 0.022inch; Depth: 0.55mm; Reach SVHC Compliant: No; Military Standard: Not; Lead Free: Lead Free; RoHS Compliant: Yes; ComponentLink1URL: https://datasheet.ciiva.com/11801/0900766b80f10809-11801396.pdf?src-supplier=Rs; ComponentLink1Description: https://datasheet.ciiva.com/11801/0900766b80f10809-11801396.pdf?src-supplier=Rs; ComponentLink2URL: https://datasheet.ciiva.com/1038/l0075s0083lqg15hs-1038125.pdf?src-supplier=Digikey; ComponentLink2Description: https://datasheet.ciiva.com/1038/l0075s0083lqg15hs-1038125.pdf?src-supplier=Digikey; ComponentLink3URL: https://datasheet.ciiva.com/1038/l0075s0083lqg15hs-1038124.pdf?src-supplier=Digikey; ComponentLink3Description: https://datasheet.ciiva.com/1038/l0075s0083lqg15hs-1038124.pdf?src-supplier=Digikey; ComponentLink4URL: https://datasheet.ciiva.com/1038/l0075s0083lqg15hs-1038126.pdf?src-supplier=Digikey; ComponentLink4Description: https://datasheet.ciiva.com/1038/l0075s0083lqg15hs-1038126.pdf?src-supplier=Digikey; ComponentLink5URL: https://datasheet.ciiva.com/8510/l0075s0083lqg15hs-8510821.pdf?src-supplier=Avnet; ComponentLink5Description: https://datasheet.ciiva.com/8510/l0075s0083lqg15hs-8510821.pdf?src-supplier=Avnet; ComponentLink6URL: https://datasheet.ciiva.com/16444/l0075s0083lqg15hs-16444389.pdf?src-supplier=Future+Electronics; ComponentLink6Description: https://datasheet.ciiva.com/16444/l0075s0083lqg15hs-16444389.pdf?src-supplier=Future+Electronics; LCSC Part Number: C86060
L5 L9 L12 = LQG15HN33NH02D: 300mA 33nH ±3% 670mΩ 0402 Inductors (SMD) ROHS; Manufacturer: Murata Electronics; Manufacturer Part Number: LQG15HN33NH02D; Package: 0402; LCSC Part Number: C2044267; Item Type: Inductor; ComponentLink1Description: LCSC; ComponentLink1URL: https://www.lcsc.com/product-detail/Inductors-SMD_Murata-Electronics-LQG15HN33NH02D_C2044267.html
L13 L22 L42 = LQG15HZ27NH02D: FIXED IND 27NH 350MA 460MOHM SMD; Manufacturer: Murata; Core Material: Air; Tolerance: 3%; Shielding: Unshielded; DC Resistance (DCR): 460mR; Self Resonant Frequency: 1.7GHz; Test Frequency: 100MHz; Item Type: Inductor; Supplier: Mouser; Supplier Part Number: 81-LQG15HZ27NH02D; Manufacturer Part Number: LQG15HZ27NH02D; RoHS: Yes; Category: Fixed Inductors; Stock: 436; Pricing: 1=0.1, 10=0.068, 50=0.068, 100=0.047, 1000=0.03, 10000=0.026 (USD); Mounting Technology: Surface Mount; Case/Package: 0402; Case Code (Imperial): 0402; Case Code (Metric): 1005; Min Operating Temperature: -55°C; Max Operating Temperature: 125°C; Packaging: Cut Tape; Value: 27nH; Current Rating: 350mA; Series: LQG15; Ratings: AEC-Q200; RoHS Compliant: Yes; ComponentLink1URL: http://search.murata.co.jp/Ceramy/image/img/P02/JELF243B-9110.pdf?src-supplier=Digi-Key; ComponentLink1Description: http://search.murata.co.jp/Ceramy/image/img/P02/JELF243B-9110.pdf?src-supplier=Digi-Key; LCSC Part Number: C237452
L16 L40 = LQG15HS22NH02D: FIXED IND 22NH 350MA 420MOHM SMD; Manufacturer: Murata; Core Material: Air; Tolerance: 3%; Shielding: Unshielded; DC Resistance (DCR): 420mR; Self Resonant Frequency: 1.9GHz; Test Frequency: 100MHz; Item Type: Inductor; Supplier: Arrow Electronics; Supplier Part Number: LQG15HS22NH02D; Manufacturer Part Number: LQG15HS22NH02D; RoHS: Yes; Category: Fixed Inductors; Stock: 2924; Pricing: 1=0.0948, 10=0.044, 25=0.0437, 100=0.0323, 250=0.032, 500=0.0317, 1000=0.019 (USD); Mounting Technology: Surface Mount; Case/Package: 0402; Min Operating Temperature: -55°C; Max Operating Temperature: 125°C; Series: LQG15; Value: 22nH; RoHS Compliant: Yes; LCSC Part Number: C2041459
L17 = LQG15HS22NH02D: FIXED IND 22NH 350MA 420MOHM SMD / LQG15HS22NH02D; Manufacturer: Murata; Core Material: Air; Tolerance: 3%; Shielding: Unshielded; DC Resistance (DCR): 420mR; Self Resonant Frequency: 1.9GHz; Test Frequency: 100MHz; Item Type: Inductor; Supplier: Arrow Electronics; Supplier Part Number: LQG15HS22NH02D; Manufacturer Part Number: LQG15HS22NH02D; RoHS: Yes; Category: Fixed Inductors; Stock: 2924; Pricing: 1=0.0948, 10=0.044, 25=0.0437, 100=0.0323, 250=0.032, 500=0.0317, 1000=0.019 (USD); Mounting Technology: Surface Mount; Case/Package: 0402; Min Operating Temperature: -55°C; Max Operating Temperature: 125°C; Series: LQG15; Value: 22nH; RoHS Compliant: Yes; LCSC Part Number: C2041459
L38 L41 = LQG15HS1N8S02D: FIXED IND 1.8NH 950MA 100MOHM SM; Manufacturer: Murata; Item Type: Inductor; Supplier: Arrow Electronics; Supplier Part Number: LQG15HS1N8S02D; Manufacturer Part Number: LQG15HS1N8S02D; RoHS: Yes; Category: Fixed Inductors; Stock: 78648; Pricing: 10000=0.0177, 50000=0.017 (USD); ComponentLink1URL: https://datasheet.ciiva.com/11801/0900766b80f10809-11801404.pdf?src-supplier=Rs; ComponentLink1Description: https://datasheet.ciiva.com/11801/0900766b80f10809-11801404.pdf?src-supplier=Rs; ComponentLink2URL: https://datasheet.ciiva.com/4977/o05e-4977799.pdf?src-supplier=Mouser; ComponentLink2Description: https://datasheet.ciiva.com/4977/o05e-4977799.pdf?src-supplier=Mouser; ComponentLink3URL: https://datasheet.ciiva.com/8510/l0075s0083lqg15hs-8510837.pdf?src-supplier=Avnet; ComponentLink3Description: https://datasheet.ciiva.com/8510/l0075s0083lqg15hs-8510837.pdf?src-supplier=Avnet; ComponentLink4URL: https://datasheet.ciiva.com/6690/l0075s0083lqg15hs-6690759.pdf?src-supplier=Digikey; ComponentLink4Description: https://datasheet.ciiva.com/6690/l0075s0083lqg15hs-6690759.pdf?src-supplier=Digikey; ComponentLink5URL: https://datasheet.ciiva.com/6690/l0075s0083lqg15hs-6690762.pdf?src-supplier=Digikey; ComponentLink5Description: https://datasheet.ciiva.com/6690/l0075s0083lqg15hs-6690762.pdf?src-supplier=Digikey; ComponentLink6URL: https://datasheet.ciiva.com/6690/l0075s0083lqg15hs-6690763.pdf?src-supplier=Digikey; ComponentLink6Description: https://datasheet.ciiva.com/6690/l0075s0083lqg15hs-6690763.pdf?src-supplier=Digikey; LCSC Part Number: C77107
L39 = LQG15HS4N7S02D: FIXED IND 4.7NH 700MA 180MOHM SM; Manufacturer: Murata; Core Material: Air; Self Resonant Frequency: 6GHz; Q Factor: 8; Current Rating: 300mA; Shielding: Unshielded; DC Resistance (DCR): 180mR; Test Frequency: 100MHz; ESR: 160mR; Item Type: Inductor; Supplier: Avnet; Supplier Part Number: LQG15HS4N7S02D; Manufacturer Part Number: LQG15HS4N7S02D; RoHS: Yes; Category: Fixed Inductors; Stock: 30000; Pricing: 10000=0.02036, 20000=0.01989, 40000=0.01942 (USD); Mounting Technology: Surface Mount; Case/Package: 0402; Case Code (Metric): 1005; Case Code (Imperial): 0402; Min Operating Temperature: -55°C; Max Operating Temperature: 125°C; Package Quantity: 1; Packaging: Tape and Reel; Value: 4.7nH; Max DC Current: 300mA; Termination: SMD/SMT; DC Current: 300mA; Series: LQG15HS; Max Current Rating: 300mA; RMS Current (Irms): 700mA; Length: 1mm; Width: 0.02inch; Height: 0.5mm; Height - Seated (Max): 0.022inch; Depth: 0.55mm; Military Standard: Not; Lead Free: Lead Free; RoHS Compliant: Yes; ComponentLink1URL: https://datasheet.ciiva.com/11799/0900766b8090d685-11799034.pdf?src-supplier=Rs; ComponentLink1Description: https://datasheet.ciiva.com/11799/0900766b8090d685-11799034.pdf?src-supplier=Rs; ComponentLink2URL: https://datasheet.ciiva.com/1038/l0075s0083lqg15hs-1038121.pdf?src-supplier=Digikey; ComponentLink2Description: https://datasheet.ciiva.com/1038/l0075s0083lqg15hs-1038121.pdf?src-supplier=Digikey; ComponentLink3URL: https://datasheet.ciiva.com/1038/l0075s0083lqg15hs-1038123.pdf?src-supplier=Digikey; ComponentLink3Description: https://datasheet.ciiva.com/1038/l0075s0083lqg15hs-1038123.pdf?src-supplier=Digikey; ComponentLink4URL: https://datasheet.ciiva.com/8509/l0075s0083lqg15hs-8509718.pdf?src-supplier=Avnet; ComponentLink4Description: https://datasheet.ciiva.com/8509/l0075s0083lqg15hs-8509718.pdf?src-supplier=Avnet; ComponentLink5URL: https://datasheet.ciiva.com/1038/l0075s0083lqg15hs-1038122.pdf?src-supplier=Digikey; ComponentLink5Description: https://datasheet.ciiva.com/1038/l0075s0083lqg15hs-1038122.pdf?src-supplier=Digikey; LCSC Part Number: C86065
R9-R12 = RC0402FR-0756KL: RES 56K OHM 1% 1/16W 0402; Manufacturer: Yageo; Power Rating: 62.5mW; Temperature Coefficient: 100ppm/°C; Value: 56kR; Voltage Rating: 50V; Max Power Dissipation: 63mW; Item Type: Resistor; Supplier 1: Future Electronics; Manufacturer Part Number: RC0402FR-0756KL; RoHS: Yes; Category: Chip SMD Resistors; Stock 1: 2610000; Pricing 1: 10000=0.001, 50000=0.001, 300000=0.0009, 1000000=0.0009, 3000000=0.0008 (USD); Case/Package: 0402; Case Code (Metric): 1005; Case Code (Imperial): 0402; Min Operating Temperature: -55°C; Max Operating Temperature: 155°C; Tolerance: 1%; Series: RC; Technology: THICK FILM; Package Quantity: 1; Packaging: Tape and Reel; Resistor Type: Thick Film; Number of Terminations: 2; Termination: SMD/SMT; Working Voltage: 50V; Features: Moisture Resistant; Construction: Rectangular; Resistance Tolerance: 1%; Length: 0.039inch; Width: 0.02inch; Height: 0.016inch; Depth: 0.5mm; RoHS Compliant: Yes; Reach SVHC Compliant: No; Military Standard: Not; Lead Free: Lead Free; ComponentLink1URL: https://datasheet.ciiva.com/46412/1018594-46412840.pdf?src-supplier=Element14; ComponentLink1Description: https://datasheet.ciiva.com/46412/1018594-46412840.pdf?src-supplier=Element14; ComponentLink2URL: https://datasheet.ciiva.com/2453/pyu-r-int-thick-7-2453479.pdf?src-supplier=Digi-Key; ComponentLink2Description: https://datasheet.ciiva.com/2453/pyu-r-int-thick-7-2453479.pdf?src-supplier=Digi-Key; ComponentLink3URL: https://datasheet.ciiva.com/2453/pyu-r-int-thick-7-2453480.pdf?src-supplier=Digi-Key; ComponentLink3Description: https://datasheet.ciiva.com/2453/pyu-r-int-thick-7-2453480.pdf?src-supplier=Digi-Key; ComponentLink4URL: https://datasheet.ciiva.com/2453/pyu-r-int-thick-7-2453478.pdf?src-supplier=Digi-Key; ComponentLink4Description: https://datasheet.ciiva.com/2453/pyu-r-int-thick-7-2453478.pdf?src-supplier=Digi-Key; ComponentLink5URL: https://datasheet.ciiva.com/5558/pyu-rc0402-51-rohs-l-6-r-5558279.pdf?src-supplier=Mouser; ComponentLink5Description: https://datasheet.ciiva.com/5558/pyu-rc0402-51-rohs-l-6-r-5558279.pdf?src-supplier=Mouser; ComponentLink6URL: https://datasheet.ciiva.com/7850/1018594-7850045.pdf?src-supplier=Element14; ComponentLink6Description: https://datasheet.ciiva.com/7850/1018594-7850045.pdf?src-supplier=Element14; ComponentLink7URL: https://datasheet.ciiva.com/7850/1018594-7850044.pdf?src-supplier=Element14; ComponentLink7Description: https://datasheet.ciiva.com/7850/1018594-7850044.pdf?src-supplier=Element14; Supplier Part Number 1: 3873767; LCSC Part Number: C114756
U3-U6 = CC1101RGPR: IC RF TXRX ISM<1GHZ 20VFQFN; Manufacturer: Texas Instruments; Min Supply Voltage: 1.8V; Max Supply Voltage: 3.6V; Data Rate: 600Kbps; Frequency: 928MHz; Interface: SPI; Number of Receivers: 1; Sensitivity: -116dBm; Density: 0B; Current - Receiving: 17.1mA; Current - Transmitting: 34.2mA; Output Power (dBm): 12dBm; Supplier: Mouser; Supplier Part Number: 595-CC1101RGPR; Manufacturer Part Number: CC1101RGPR; RoHS: Yes; Category: RF Receivers, Transceivers; Stock: 8617; Pricing: 1=3.07, 10=2.76, 50=2.76, 100=2.26, 250=2.14, 500=1.92, 1000=1.62, 3000=1.54, 6000=1.48, 10000=1.54 (USD); Mounting Technology: Surface Mount; Case/Package: QFN; Pins: 20; Contact Plating: Gold; Weight: 0.002469oz; Min Operating Temperature: -40°C; Max Operating Temperature: 85°C; Packaging: Tape and Reel; Package Quantity: 3000; Number of Transmitters: 1; Clock Frequency: 928MHz; Series: -; Length: 4.15mm; Depth: 4.15mm; Reach SVHC Compliant: No; Lead Free: Lead Free; RoHS Compliant: Yes; ComponentLink1URL: https://datasheet.ciiva.com/15040/cc1101-15040501.pdf?src-supplier=Digi-Key; ComponentLink1Description: https://datasheet.ciiva.com/15040/cc1101-15040501.pdf?src-supplier=Digi-Key; ComponentLink2URL: https://datasheet.ciiva.com/15040/cc1101-15040502.pdf?src-supplier=Digi-Key; ComponentLink2Description: https://datasheet.ciiva.com/15040/cc1101-15040502.pdf?src-supplier=Digi-Key; LCSC Part Number: C29953; Item Type: IC
X2-X5 = NX3225GA-26MHZ-EXS00A-CG01972: SMD3225-4P Crystals ROHS; Manufacturer: NDK; Manufacturer Part Number: NX3225GA-26MHZ-EXS00A-CG01972; Package: SMD3225-4P; LCSC Part Number: C485372; Item Type: Crystal; ComponentLink1Description: LCSC; ComponentLink1URL: https://www.lcsc.com/product-detail/Crystals_NDK-NX3225GA-26MHZ-EXS00A-CG01972_C485372.html